# Altium project vend-PCB-003.PrjPcb
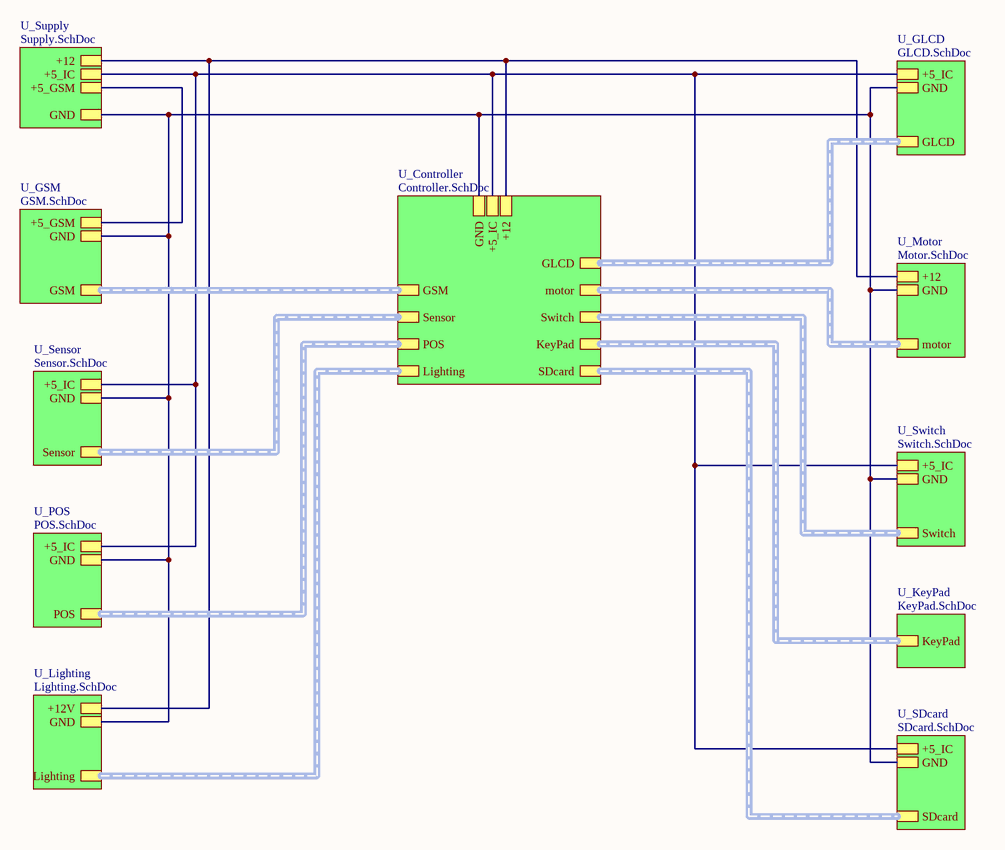
[diagram p0: main.SchDoc]
CompanyName: github.com/rshahrami; DrawnBy: rshahrami; Project_Name: vend-PCB-003; Revision: 1.0.0
12 sheets, 130 parts. Net scope: strictly hierarchical (ports join the sheet entries above them; power ports are local).
Board file: PCB.PcbDoc
Sheets:
  main.SchDoc
    U_GLCD = GLCD.SchDoc
    U_Controller = Controller.SchDoc
    U_GSM = GSM.SchDoc
    U_Motor = Motor.SchDoc
    U_POS = POS.SchDoc
    U_Sensor = Sensor.SchDoc
    U_Supply = Supply.SchDoc
    U_Switch = Switch.SchDoc
    U_KeyPad = KeyPad.SchDoc
    U_SDcard = SDcard.SchDoc
    U_Lighting = Lighting.SchDoc

## Sheet main.SchDoc
size A4; SheetNumber: 1; SheetTotal: 12

### Sub-sheets
U_Controller = Controller.SchDoc: GSM (harness GSM), motor (harness motor), Switch (harness Switch), GLCD (harness GLCD), +12, GND, Sensor (harness Sensor), KeyPad (harness KeyPad), SDcard (harness SDcard), Lighting (harness Lighting), POS (harness POS), +5_IC
U_GLCD = GLCD.SchDoc: GLCD (harness GLCD), GND, +5_IC
U_GSM = GSM.SchDoc: GND, GSM (harness GSM), +5_GSM
U_KeyPad = KeyPad.SchDoc: KeyPad (harness KeyPad)
U_Lighting = Lighting.SchDoc: +12V, GND, Lighting (harness Lighting)
U_Motor = Motor.SchDoc: motor (harness motor), +12, GND
U_POS = POS.SchDoc: POS (harness POS), GND, +5_IC
U_SDcard = SDcard.SchDoc: GND, SDcard (harness SDcard), +5_IC
U_Sensor = Sensor.SchDoc: GND, Sensor (harness Sensor), +5_IC
U_Supply = Supply.SchDoc: GND, +12, +5_GSM, +5_IC
U_Switch = Switch.SchDoc: GND, Switch (harness Switch), +5_IC

### Nets
+5_GSM: sheet U_GSM/+5_GSM, sheet U_Supply/+5_GSM
+5_IC: sheet U_GLCD/+5_IC, sheet U_Controller/+5_IC, sheet U_POS/+5_IC, sheet U_Sensor/+5_IC, sheet U_Supply/+5_IC, sheet U_Switch/+5_IC, sheet U_SDcard/+5_IC
+12: sheet U_Controller/+12, sheet U_Motor/+12, sheet U_Supply/+12, sheet U_Lighting/+12V
GND: sheet U_GLCD/GND, sheet U_Controller/GND, sheet U_GSM/GND, sheet U_Motor/GND, sheet U_POS/GND, sheet U_Sensor/GND, sheet U_Supply/GND, sheet U_Switch/GND, sheet U_SDcard/GND, sheet U_Lighting/GND

### Buses and harness runs
harness sheet U_Controller/GLCD = sheet U_GLCD/GLCD
harness sheet U_Controller/GSM = sheet U_GSM/GSM
harness sheet U_Controller/KeyPad = sheet U_KeyPad/KeyPad
harness sheet U_Controller/Lighting = sheet U_Lighting/Lighting
harness sheet U_Controller/motor = sheet U_Motor/motor
harness sheet U_Controller/POS = sheet U_POS/POS
harness sheet U_Controller/SDcard = sheet U_SDcard/SDcard
harness sheet U_Controller/Sensor = sheet U_Sensor/Sensor
harness sheet U_Controller/Switch = sheet U_Switch/Switch

## Sheet GLCD.SchDoc
size A4; SheetNumber: 5; SheetTotal: 12
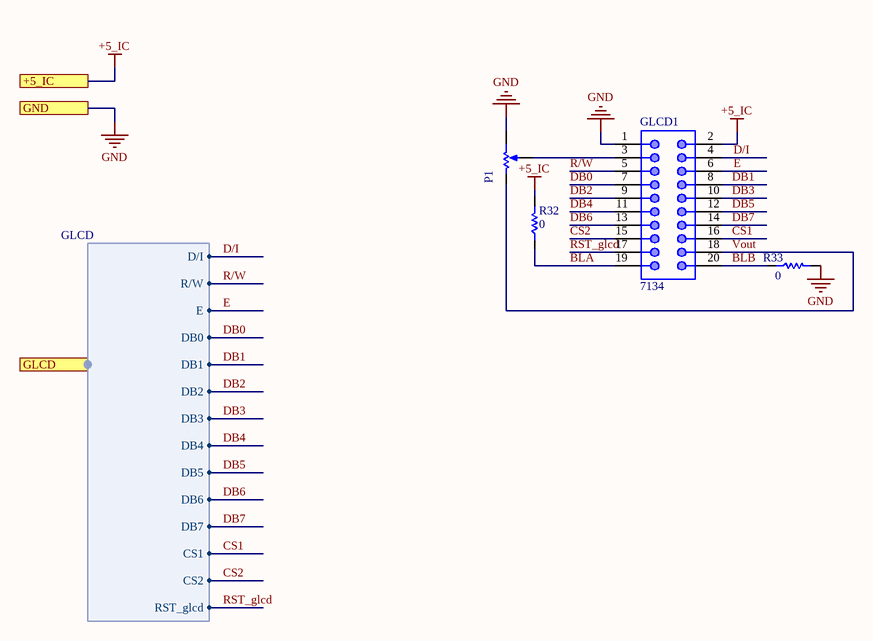
[diagram p1: GLCD.SchDoc]

### Parts
GLCD1  Inflow: 7134  [BOX-HDR-10X2-2.54mm-S]  (hidden comment: 10x2)
P1  10K  [Multi turn 01]  (value not drawn)
R32  0  [RES 1206 (3216X08L)]
R33  0  [RES 1206 (3216X08L)]

### Ports
+5_IC, GLCD (harness GLCD), GND

### Harnesses
GLCD: D/I, R/W, E, DB0, DB1, DB2, DB3, DB4, DB5, DB6, DB7, CS1, CS2, RST_glcd

### Nets
+5_IC: GLCD1.2 R32.2 ; port +5_IC
GND: GLCD1.1 P1.1 R33.2 ; port GND
BLA: GLCD1.19 R32.1
BLB: GLCD1.20 R33.1
CS1: GLCD1.16 ; port GLCD.CS1
CS2: GLCD1.15 ; port GLCD.CS2
D/I: GLCD1.4 ; port GLCD.D/I
DB0: GLCD1.7 ; port GLCD.DB0
DB1: GLCD1.8 ; port GLCD.DB1
DB2: GLCD1.9 ; port GLCD.DB2
DB3: GLCD1.10 ; port GLCD.DB3
DB4: GLCD1.11 ; port GLCD.DB4
DB5: GLCD1.12 ; port GLCD.DB5
DB6: GLCD1.13 ; port GLCD.DB6
DB7: GLCD1.14 ; port GLCD.DB7
E: GLCD1.6 ; port GLCD.E
R/W: GLCD1.5 ; port GLCD.R/W
RST_glcd: GLCD1.17 ; port GLCD.RST_glcd
Vout: GLCD1.18 P1.3
NetGLCD1_3: GLCD1.3 P1.2

### Library data of the parts
GLCD1 = Con_IDC_10x2: Male Box Header, 20 pins; Rating: Rating?; Validation: NT; Value: 10x2; Package: Package?; Type: Type?
P1 = Res_Multi: Multi Turn; Rating: Rating?; Validation: Valid; Inflow: inflow?; Package: Package?; Type: Type?; Value: 10K
R32 R33 = Res_SMD_1206: Resistor; Inflow: inflow?; Rating: 0.25W; Validation: Valid; Package: 1206; Type: 10%; Value: 0

## Sheet Controller.SchDoc
size 254 x 228 mm; SheetNumber: 2; SheetTotal: 12
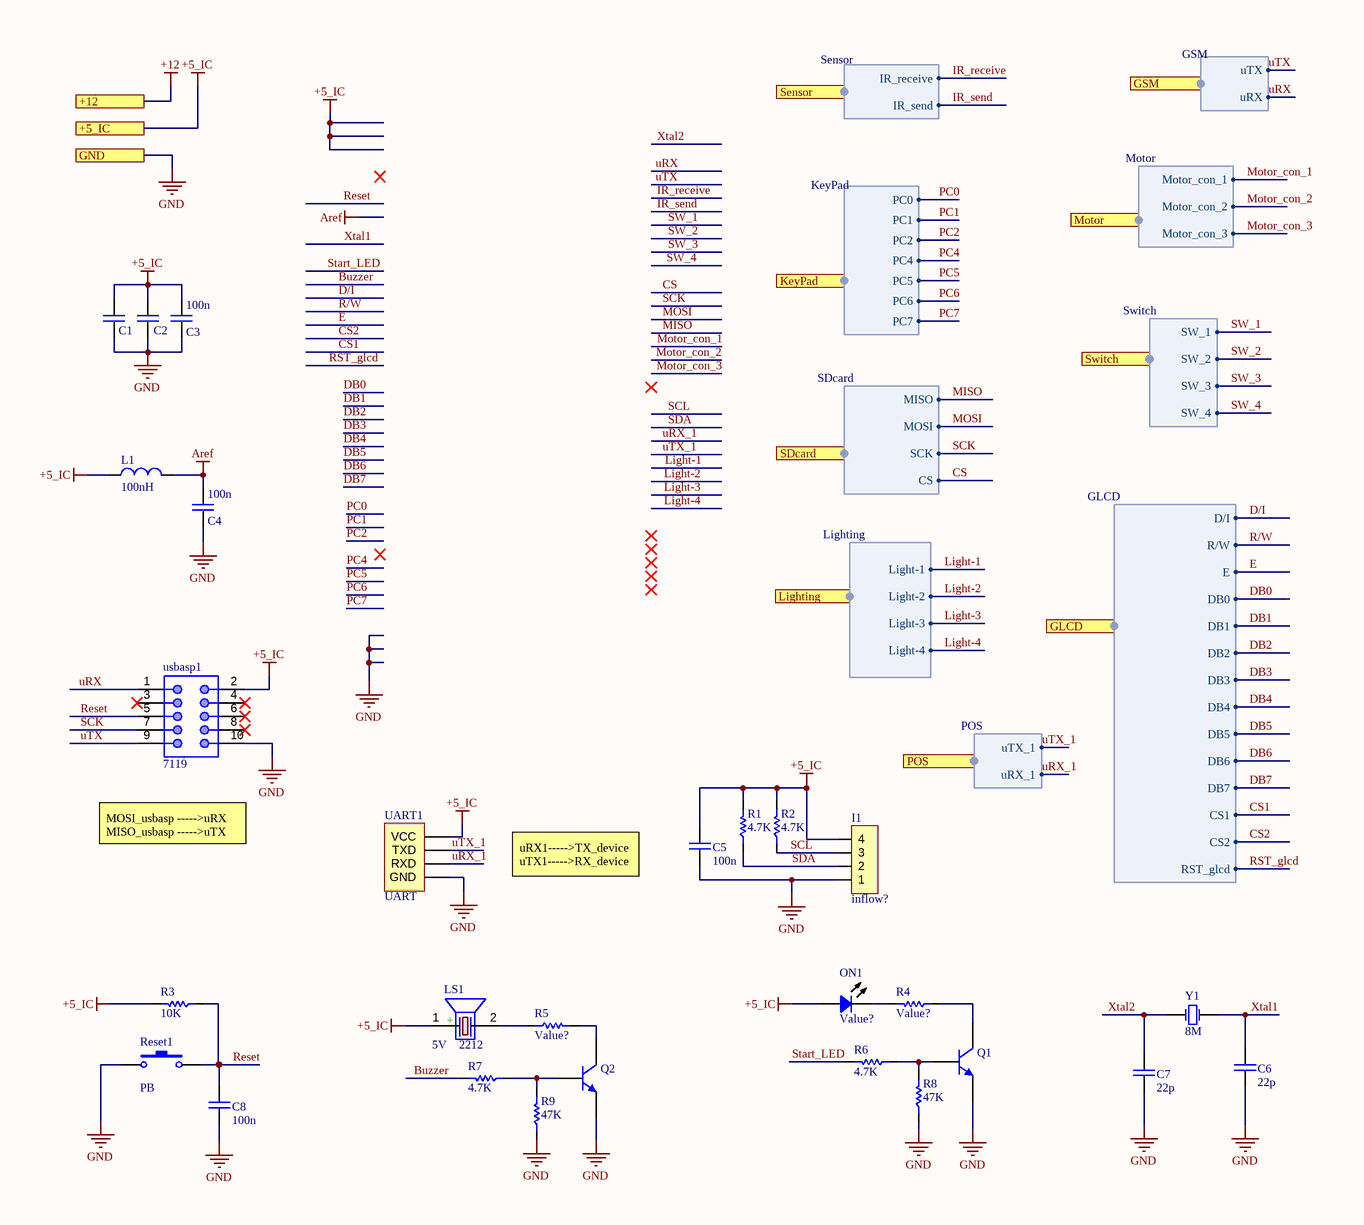
[diagram p2: Controller.SchDoc]

### Parts
C1  (no value)  [CAP 1206/3216]
C2  (no value)  [CAP 1206/3216]
C3  100n  [CAP 1206/3216]
C4  100n  [CAP 1206/3216]
C5  100n  [CAP 1206/3216]
C6  22p  [CAP 1206/3216]
C7  22p  [CAP 1206/3216]
C8  100n  [CAP 1206/3216]
I1  Inflow: inflow?  [MOLEX KK 0022272041]  (hidden comment: 4'Pin)
L1  100nH  [IND1206]
LS1  Inflow: 2212  [BZ_SJ]  (hidden comment: 5V)
ON1  Value?  [LED 1206/3216 GREEN]
Q1  NPN  [SOT23_N]  (value not drawn)
Q2  NPN  [SOT23_N]  (value not drawn)
R1  value 4.7K  [RES 1206 (3216X08L)]  (hidden comment: Value?)
R2  value 4.7K  [RES 1206 (3216X08L)]  (hidden comment: Value?)
R3  value 10K  [RES 1206 (3216X08L)]  (hidden comment: 4.7K)
R4  value Value?  [RES 1206 (3216X08L)]  (hidden comment: 47K)
R5  Value?  [RES 1206 (3216X08L)]
R6  value 4.7K  [RES 1206 (3216X08L)]  (hidden comment: Value?)
R7  4.7K  [RES 1206 (3216X08L)]
R8  value 47K  [RES 1206 (3216X08L)]  (hidden comment: 4.7K)
R9  47K  [RES 1206 (3216X08L)]
Reset1  PB  [SW_PB_SMD_2PIN_SPST_6X3X2]
UART1  UART  [MOLEX KK 0022272041]
usbasp1  Inflow: 7119  [BOX-HDR-5X2-2.54mm-S]  (hidden comment: 5x2)
Y1  8M  [XTAL Small]

### Ports
+5_IC, +12, GLCD (harness GLCD), GND, GSM (harness GSM), KeyPad (harness KeyPad), Lighting (harness Lighting), Motor (harness Motor), POS (harness POS), SDcard (harness SDcard), Sensor (harness Sensor), Switch (harness Switch)

### Harnesses
GSM: uTX, uRX
Switch: SW_1, SW_2, SW_3, SW_4
GLCD: D/I, R/W, E, DB0, DB1, DB2, DB3, DB4, DB5, DB6, DB7, CS1, CS2, RST_glcd
Sensor: IR_receive, IR_send
KeyPad: PC0, PC1, PC2, PC4, PC5, PC6, PC7
SDcard: MISO, MOSI, SCK, CS
Lighting: Light-1, Light-2, Light-3, Light-4
Motor: Motor_con_1, Motor_con_2, Motor_con_3
POS: uTX_1, uRX_1

### Nets
+5_IC: C1.1 C2.1 C3.1 C5.1 I1.4 L1.1 LS1.1(+) ON1.1 R1.2 R2.2 R3.2 UART1.1(VCC) usbasp1.2 ; port +5_IC
Aref: C4.1 L1.2
GND: C1.2 C2.2 C3.2 C4.2 C5.2 C6.2 C7.2 C8.2 I1.1 Q1.2(E) Q2.2(E) R8.1 R9.1 Reset1.1 UART1.4(GND) usbasp1.10 ; port GND
Buzzer: R7.2
Reset: C8.1 R3.1 Reset1.2 usbasp1.5
SCK: usbasp1.7 ; port SDcard.SCK
SCL: I1.3 R2.1
SDA: I1.2 R1.1
Start_LED: R6.2
uRX: usbasp1.1 ; port GSM.uRX
uRX_1: UART1.3(RXD) ; port POS.uRX_1
uTX: usbasp1.9 ; port GSM.uTX
uTX_1: UART1.2(TXD) ; port POS.uTX_1
Xtal1: C6.1 Y1.2(OSC2)
Xtal2: C7.1 Y1.1(OSC1)
NetLS1_2: LS1.2(-) R5.1
NetON1_2: ON1.2 R4.2
NetQ1_1: Q1.1(B) R6.1 R8.2
NetQ1_3: Q1.3(C) R4.1
NetQ2_1: Q2.1(B) R7.1 R9.2
NetQ2_3: Q2.3(C) R5.2

Not connected (* = marked no-connect by the designer): usbasp1 3* 4* 6* 8*

### Notes on the sheet
- MOSI_usbasp ----->uRX MISO_usbasp ----->uTX
- uRX1----->TX_device
  uTX1----->RX_device
- DWG. NO.
- REV.
- SHT.
- THIS DOCUMENT AND THE DATA DISCLOSED HEREIN OR HEREWITH IS THE PROPERTY OF ALTIUM LIMITED AND MAY BE FREELY DISTRIBUTED IN WHOLE. NO RIGHTS ARE RESERVED OR EXPRESS OR IMPLIED WARANTEE GIVEN.
- REVISION
- DESCRIPTION
- DATE
- APPROVED
- ENG:
- APPROVALS
- PROJECT
- DSN:
- CHK:
- REFERENCE DOCUMENTS
- PROJECT REVISION:
- TITLE
- DOCUMENT REVISION:
- DESIGN ITEM:
- BOM:
- FAB DWG:
- PCB DWG:
- ASSY DWG:
- SCALE:
- SIZE
- B
- CAGE CODE
- FILE NAME
- DWG NO.
- SHEET
- OF
- REV

### Library data of the parts
C1-C8 = Cap_Multi_SMD_100nF_1206: Bipolar ceramic capacitor SMD; Type: MultiLayer; Inflow: inflow?; Rating: 50V; Validation: Valid; Package: 1206
  C3-C5 C8: Value: 100n
  C6 C7: Value: 22p
I1 = Con_Signal_4: Signal Connector 4'Pin; Rating: Rating?; Validation: Valid; Value: 4'Pin; Package: Package?; Type: Type?
L1 = Ind_SMD_1206: Inductor; Inflow: inflow?; Type: SMD; Rating: Rating?; Validation: Valid; Package: 1206; Value: 100nH
LS1 = Other_Elec_Buzzer: Magnetic Transducer Buzzer; Rating: 12mm; Validation: Valid; Type: Buzzer; Package: Dip; Value: 5V
ON1 = Semi_LED_SMD: LED; Inflow: inflow?; Rating: Rating?; Validation: Valid; Package: Package?; Type: LED; Value: Value?
Q1 Q2 = Semi_BJT_BC817: NPN General purpose Transistor; Rating: Rating?; Type: Type?; Validation: Valid; Inflow: inflow?; Value: NPN; Package: Package?
R1 R2 = Res_SMD_0805: Resistor; Inflow: inflow?; Rating: 0.125W; Validation: Valid; Package: 0805; Type: 10%
R3-R9 = Res_SMD_1206: as R32 on sheet GLCD; Package: 1206; Type: 10%
  R5: Value: Value?
  R7: Value: 4.7K
  R9: Value: 47K
Reset1 = SW_PushButton_2_SMD: SMT Tactile ‎Switch; Rating: 2b; Validation: Valid; Inflow: 8260; Type: Vertical; Package: SMD; Value: PB
UART1 = Con_UART: UART Connector; Rating: Rating?; Validation: Valid; Inflow: 4528; Package: Package?; Type: Type?; Value: UART
usbasp1 = Con_IDC_5x2: Male Box Header, 10 pins; Rating: Rating?; Validation: NT; Value: 5x2; Package: Package?; Type: Type?
Y1 = Other_Elec_Xtal_THT: Crystal Oscillator; Rating: Rating?; Inflow: inflow?; Validation: Valid; Type: Quartz; Package: Dip; Value: 8M

## Sheet GSM.SchDoc
size A4; SheetNumber: 3; SheetTotal: 12
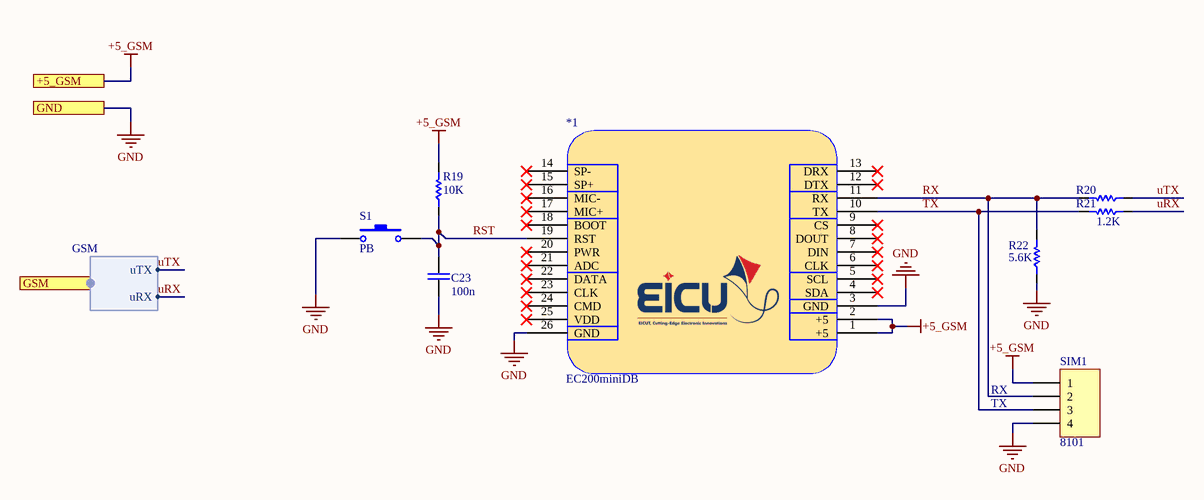
[diagram p3: GSM.SchDoc]

### Parts
*1  EC200miniDB  [PCBComponent_1]
C23  100n  [CAP 1206/3216]
R19  10K  [RES 1206 (3216X08L)]
R20  47K  [RES 1206 (3216X08L)]  (value not drawn)
R21  value 1.2K  [RES 1206 (3216X08L)]  (hidden comment: 1K)
R22  5.6K  [RES 1206 (3216X08L)]
S1  PB  [SW_PB_SMD_2PIN_SPST_6X3X2]
SIM1  Inflow: 8101  [HDR_THT_4F_2.54mm]  (hidden comment: 4)

### Ports
+5_GSM, GND, GSM (harness GSM)

### Harnesses
GSM: uTX, uRX

### Nets
+5_GSM: *1.1(+5) *1.2(+5) R19.2 SIM1.1 ; port +5_GSM
GND: *1.3(GND) *1.26(GND) C23.2 R22.1 S1.2 SIM1.4 ; port GND
RST: *1.19(RST) C23.1 R19.1 S1.1
RX: *1.11(RX) R20.2 R22.2 SIM1.2
TX: *1.10(TX) R21.2 SIM1.3
uRX: R21.1 ; port GSM.uRX
uTX: R20.1 ; port GSM.uTX

Not connected (* = marked no-connect by the designer): *1 4(SDA)* 5(SCL)* 6(CLK)* 7(DIN)* 8(DOUT)* 9(CS)* 12(DTX)* 13(DRX)* 14(SP-)* 15(SP+)* 16(MIC-)* 17(MIC+)* 18(BOOT)* 20(PWR)* 21(ADC)* 22(DATA)* 23(CLK)* 24(CMD)* 25(VDD)*

### Notes on the sheet
- RX
- TX

### Library data of the parts
*1 = EC200miniDB: EICUT.com
C23 = Cap_Multi_SMD_100nF_1206: as C1 on sheet Controller; Package: 1206; Value: 100n
R19-R22 = Res_SMD_1206: as R32 on sheet GLCD; Package: 1206; Type: 10%
  R19: Value: 10K
  R20: Value: 47K
  R22: Value: 5.6K
S1 = SW_PushButton_2_SMD: as Reset1 on sheet Controller; Type: Vertical; Package: SMD; Value: PB
SIM1 = Con_FPH_4x1_V_THT_2.54: Header, single row, 4 pin; Rating: Rating?; Validation: NT; Value: 4; Package: Package?; Type: Type?

## Sheet Motor.SchDoc
size A4; SheetNumber: 4; SheetTotal: 12
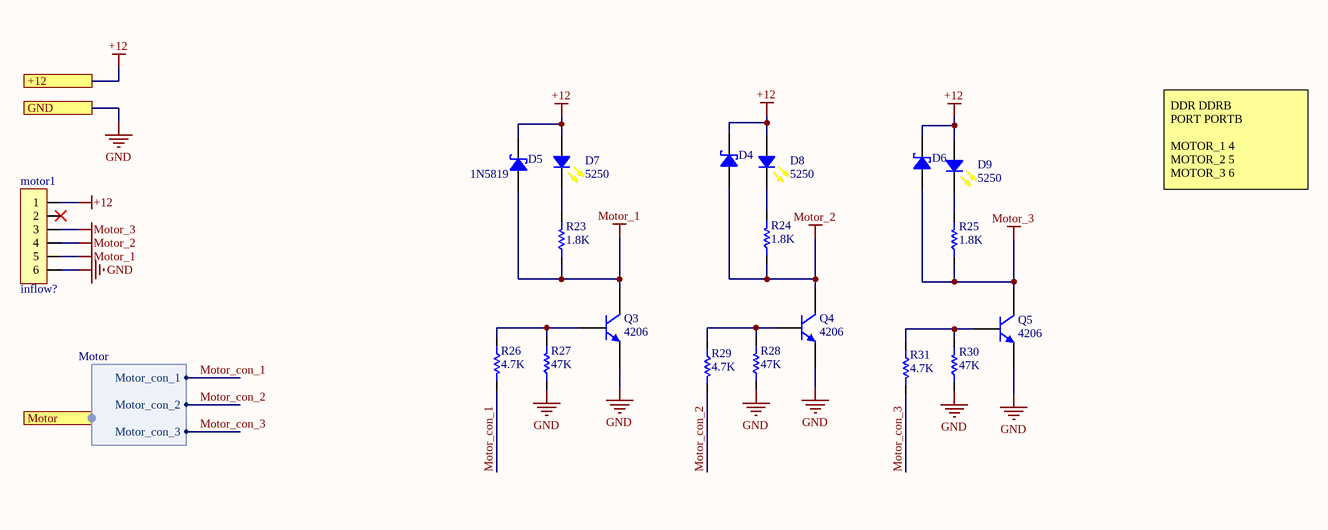
[diagram p4: Motor.SchDoc]

### Parts
D4  1N5819  [430X270D]  (value not drawn)
D5  1N5819  [430X270D]
D6  1N5819  [430X270D]  (value not drawn)
D7  Inflow: 5250  [LED 1206/3216 YELLOW]  (hidden comment: Yellow, 1206)
D8  Inflow: 5250  [LED 1206/3216 YELLOW]  (hidden comment: Yellow, 1206)
D9  Inflow: 5250  [LED 1206/3216 YELLOW]  (hidden comment: Yellow, 1206)
motor1  Inflow: inflow?  [MOLEX KK 0022272061]  (hidden comment: 6'Pin)
Q3  Inflow: 4206  [TO-220 AB]  (hidden comment: NPN)
Q4  Inflow: 4206  [TO-220 AB]  (hidden comment: NPN)
Q5  Inflow: 4206  [TO-220 AB]  (hidden comment: NPN)
R23  1.8K  [RES 1206 (3216X08L)]
R24  1.8K  [RES 1206 (3216X08L)]
R25  1.8K  [RES 1206 (3216X08L)]
R26  4.7K  [RES 1206 (3216X08L)]
R27  47K  [RES 1206 (3216X08L)]
R28  47K  [RES 1206 (3216X08L)]
R29  4.7K  [RES 1206 (3216X08L)]
R30  47K  [RES 1206 (3216X08L)]
R31  4.7K  [RES 1206 (3216X08L)]

### Ports
+12, GND, Motor (harness Motor)

### Harnesses
Motor: Motor_con_1, Motor_con_2, Motor_con_3

### Nets
+12: D4.2 D5.2 D6.2 D7.1 D8.1 D9.1 motor1.1 ; port +12
GND: motor1.6 Q3.3(E) Q4.3(E) Q5.3(E) R27.1 R28.1 R30.1 ; port GND
Motor_1: D5.1 motor1.5 Q3.2(C) R23.1
Motor_2: D4.1 motor1.4 Q4.2(C) R24.1
Motor_3: D6.1 motor1.3 Q5.2(C) R25.1
Motor_con_1: R26.2 ; port Motor.Motor_con_1
Motor_con_2: R29.2 ; port Motor.Motor_con_2
Motor_con_3: R31.2 ; port Motor.Motor_con_3
NetD7_2: D7.2 R23.2
NetD8_2: D8.2 R24.2
NetD9_2: D9.2 R25.2
NetQ3_1: Q3.1(B) R26.1 R27.2
NetQ4_1: Q4.1(B) R28.2 R29.1
NetQ5_1: Q5.1(B) R30.2 R31.1

Not connected (* = marked no-connect by the designer): motor1 2*

### Notes on the sheet
- DDR DDRB
  PORT PORTB
  MOTOR_1 4
  MOTOR_2 5
  MOTOR_3 6

### Library data of the parts
D4-D6 = Semi_Diod_Sch_1N5819_SMD: Schottky Rectifiers; Rating: Rating?; Validation: Valid; Inflow: inflow?; Package: SMA; Type: Schottky; Value: 1N5819
D7-D9 = Semi_LED_Yellow_1206: LED; Rating: Rating?; Type: Type?; Validation: Valid; Value: Yellow, 1206; Package: Package?
motor1 = Con_Signal_6: Signal Connector 6'Pin; Rating: Rating?; Validation: Valid; Value: 6'Pin; Package: Package?; Type: Type?
Q3-Q5 = Semi_BJT_TIP41C: NPN Power transistor; Rating: Rating?; Type: Type?; Validation: NT; Value: NPN; Package: Package?
R23-R31 = Res_SMD_1206: as R32 on sheet GLCD; Package: 1206; Type: 10%
  R23-R25: Value: 1.8K
  R26 R29 R31: Value: 4.7K
  R27 R28 R30: Value: 47K

## Sheet POS.SchDoc
size A4; SheetNumber: 8; SheetTotal: 12
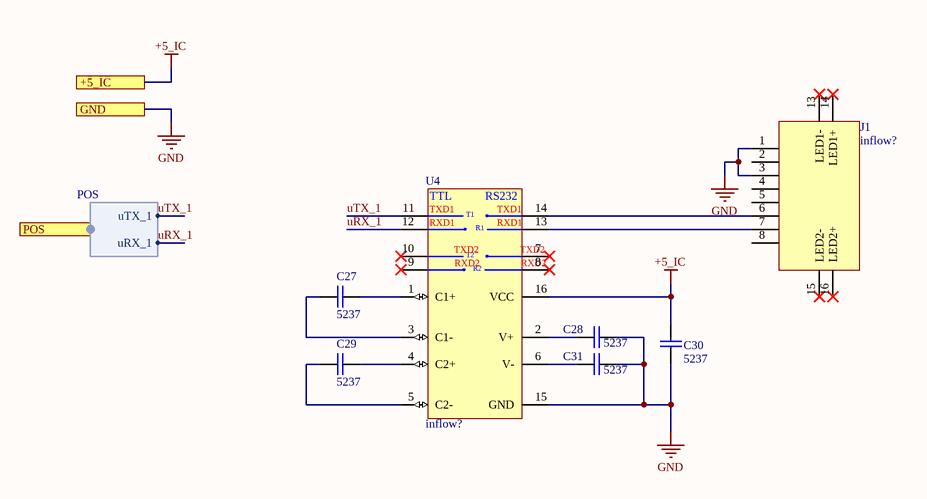
[diagram p5: POS.SchDoc]

### Parts
C27  Inflow: 5237  [CAP 1206/3216]  (hidden comment: 1u'F, 50'V)
C28  Inflow: 5237  [CAP 1206/3216]  (hidden comment: 1u'F, 50'V)
C29  Inflow: 5237  [CAP 1206/3216]  (hidden comment: 1u'F, 50'V)
C30  Inflow: 5237  [CAP 1206/3216]  (hidden comment: 1u'F, 50'V)
C31  Inflow: 5237  [CAP 1206/3216]  (hidden comment: 1u'F, 50'V)
J1  Inflow: inflow?  [RJ45_MINI]  (hidden comment: RJ45, mini)
U4  Inflow: inflow?  [NSO16_M]  (hidden comment: MAX3232)

### Ports
+5_IC, GND, POS (harness POS)

### Harnesses
POS: uTX_1, uRX_1

### Nets
+5_IC: C30.1 U4.16(VCC) ; port +5_IC
GND: C28.2 C30.2 C31.2 J1.1 J1.3 U4.15(GND) ; port GND
uRX_1: U4.12(R1OUT) ; port POS.uRX_1
uTX_1: U4.11(T1IN) ; port POS.uTX_1
NetC27_1: C27.1 U4.1(C1+)
NetC27_2: C27.2 U4.3(C1-)
NetC28_1: C28.1 U4.2(V+)
NetC29_1: C29.1 U4.4(C2+)
NetC29_2: C29.2 U4.5(C2-)
NetC31_1: C31.1 U4.6(V-)
NetJ1_6: J1.6 U4.14(T1OUT)
NetJ1_7: J1.7 U4.13(R1IN)

Not connected (* = marked no-connect by the designer): J1 2 4 5 8 13(LED1-)* 14(LED1+)* 15(LED2-)* 16(LED2+)*; U4 7(T2OUT)* 8(R2IN)* 9(R2OUT)* 10(T2IN)*

### Notes on the sheet
- (in symbol IC_Converter_MAX3232CSE) TTL; TXD1; T1; RXD1; R1; TXD2; T2; RXD2; R2

### Library data of the parts
C27-C31 = Cap_Multi_1u_50_1206: Bipolar ceramic capacitor SMD; Rating: Rating?; Type: Type?; Validation: Valid; Value: 1u'F, 50'V; Package: Package?
J1 = Con_PC_RJ45_MINI: RJ45 Mini With two LEDs; Rating: Rating?; Validation: NT; Value: RJ45, mini; Package: Package?; Type: Type?
U4 = IC_Converter_MAX3232CSE: RS-232 Interface IC 3.0V to 5.5V, Low-Power, up to 1Mbps, True RS-232 Transceivers Using Four 0.1uF External Capacitors; Rating: Rating?; Validation: Valid; Value: MAX3232; Package: SOIC-16; Type: RS232

## Sheet Sensor.SchDoc
size A4; SheetNumber: 6; SheetTotal: 12
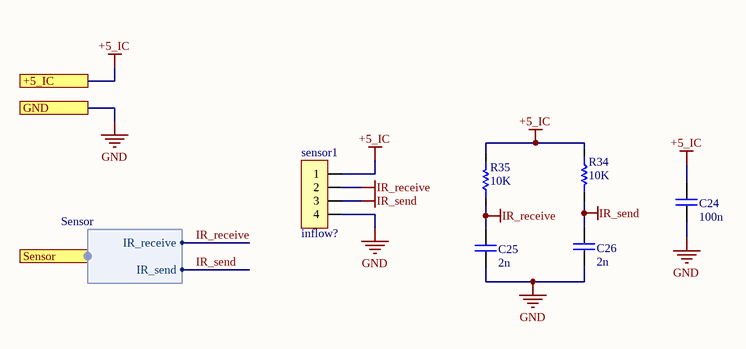
[diagram p6: Sensor.SchDoc]

### Parts
C24  100n  [CAP 1206/3216]
C25  2n  [CAP 1206/3216]
C26  2n  [CAP 1206/3216]
R34  10K  [RES 1206 (3216X08L)]
R35  10K  [RES 1206 (3216X08L)]
sensor1  Inflow: inflow?  [MOLEX KK 0022272041]  (hidden comment: 4'Pin)

### Ports
+5_IC, GND, Sensor (harness Sensor)

### Harnesses
Sensor: IR_receive, IR_send

### Nets
+5_IC: C24.1 R34.1 R35.2 sensor1.1 ; port +5_IC
GND: C24.2 C25.2 C26.2 sensor1.4 ; port GND
IR_receive: C25.1 R35.1 sensor1.2 ; port Sensor.IR_receive
IR_send: C26.1 R34.2 sensor1.3 ; port Sensor.IR_send

### Library data of the parts
C24-C26 = Cap_Multi_SMD_100nF_1206: as C1 on sheet Controller; Package: 1206
  C24: Value: 100n
  C25 C26: Value: 2n
R34 R35 = Res_SMD_1206: as R32 on sheet GLCD; Package: 1206; Type: 10%; Value: 10K
sensor1 = Con_Signal_4: as I1 on sheet Controller; Value: 4'Pin; Package: Package?; Type: Type?

## Sheet Supply.SchDoc
size A4; SheetNumber: 2; SheetTotal: 12; Time: Supply
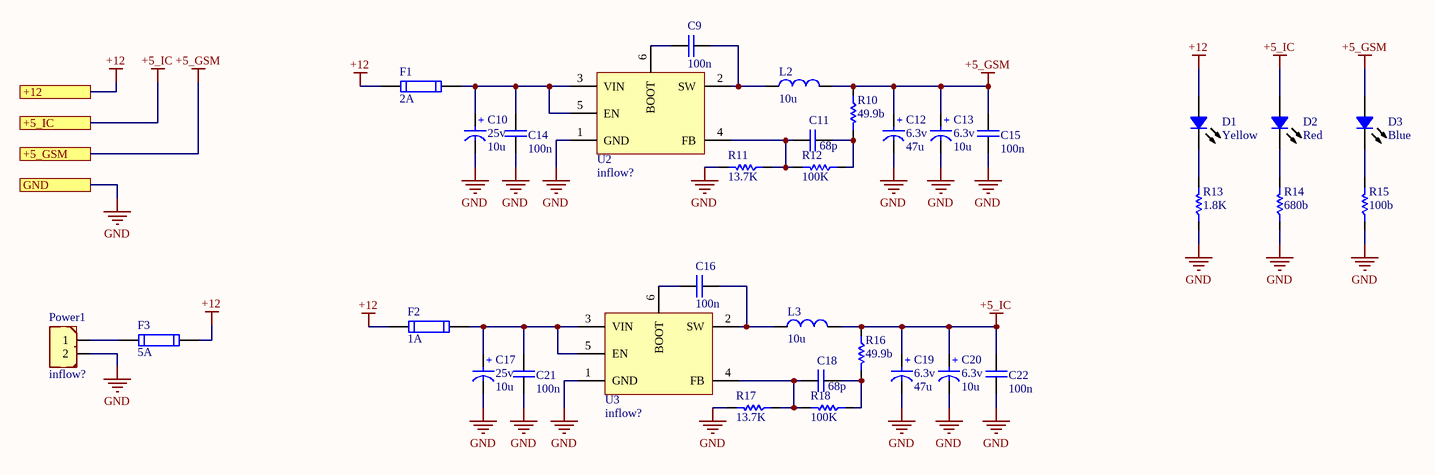
[diagram p7: Supply.SchDoc]

### Parts
C9  100n  [CAP 0805/2012]
C10  Rating: 25v  [SMT_C_Tantalum_B]  (hidden comment: 10u)
C11  68p  [CAP 0805/2012]
C12  Rating: 6.3v  [SMT_C_Tantalum_B]  (hidden comment: 47u)
C13  Rating: 6.3v  [SMT_C_Tantalum_A]  (hidden comment: 10u)
C14  100n  [CAP 1206/3216]
C15  100n  [CAP 1206/3216]
C16  100n  [CAP 0805/2012]
C17  Rating: 25v  [SMT_C_Tantalum_B]  (hidden comment: 10u)
C18  68p  [CAP 0805/2012]
C19  Rating: 6.3v  [SMT_C_Tantalum_B]  (hidden comment: 47u)
C20  Rating: 6.3v  [SMT_C_Tantalum_A]  (hidden comment: 10u)
C21  100n  [CAP 1206/3216]
C22  100n  [CAP 1206/3216]
D1  Yellow  [LED 0805/2012 YELLOW]
D2  Red  [LED 0805/2012 RED]
D3  Blue  [LED 0805/2012 BLUE]
F1  2A  [1206_F]
F2  1A  [1206_F]
F3  5A  [FUSE_BLX_20x5]
L2  10u  [L_7]
L3  10u  [L_7]
Power1  Inflow: inflow?  [Phoenix_2PIN_RA_P5.08mm]  (hidden comment: 2'Pin)
R10  49.9b  [RES 0805 (2012X06L)]
R11  13.7K  [RES 0805 (2012X06L)]
R12  100K  [RES 0805 (2012X06L)]
R13  1.8K  [RES 0805 (2012X06L)]
R14  680b  [RES 0805 (2012X06L)]
R15  100b  [RES 0805 (2012X06L)]
R16  49.9b  [RES 0805 (2012X06L)]
R17  13.7K  [RES 0805 (2012X06L)]
R18  100K  [RES 0805 (2012X06L)]
U2  Inflow: inflow?  [TPS54302]  (hidden comment: Value?)
U3  Inflow: inflow?  [TPS54302]  (hidden comment: Value?)

### Ports
+5_GSM, +5_IC, +12, GND

### Nets
+5_GSM: C12.1(+) C13.1(+) C15.1 D3.1 L2.2 R10.1 ; port +5_GSM
+5_IC: C19.1(+) C20.1(+) C22.1 D2.1 L3.2 R16.1 ; port +5_IC
+12: D1.1 F1.1 F2.1 F3.2 ; port +12
GND: C10.2(-) C12.2(-) C13.2(-) C14.2 C15.2 C17.2(-) C19.2(-) C20.2(-) C21.2 C22.2 Power1.2 R11.2 R13.1 R14.1 R15.1 R17.2 U2.1(GND) U3.1(GND) ; port GND
NetC9_1: C9.1 U2.6(BOOT)
NetC9_2: C9.2 L2.1 U2.2(SW)
NetC10_1: C10.1(+) C14.1 F1.2 U2.3(VIN) U2.5(EN)
NetC11_1: C11.1 R11.1 R12.2 U2.4(FB)
NetC11_2: C11.2 R10.2 R12.1
NetC16_1: C16.1 U3.6(BOOT)
NetC16_2: C16.2 L3.1 U3.2(SW)
NetC17_1: C17.1(+) C21.1 F2.2 U3.3(VIN) U3.5(EN)
NetC18_1: C18.1 R17.1 R18.2 U3.4(FB)
NetC18_2: C18.2 R16.2 R18.1
NetD1_2: D1.2 R13.2
NetD2_2: D2.2 R14.2
NetD3_2: D3.2 R15.2
NetF3_1: F3.1 Power1.1

### Notes on the sheet
- Title:
- Project:
- Drawn by:
- Revision:
- Hossein Bagheri
- Company:
- Sheet
- of

### Library data of the parts
C9 C16 = Cap_Multi_SMD_100nF_0805: Bipolar ceramic capacitor SMD; Inflow: inflow?; Type: MultiLayer; Rating: 50V; Validation: Valid; Package: 0805; Value: 100n
C10 C12 C13 C17 C19 C20 = Cap_Tantalum: Tantalum Capacitor,TAJ Series-SMD; Inflow: inflow?; Validation: Valid; Package: Package?; Type: Tantalum
  C10 C13 C17 C20: Value: 10u
  C12 C19: Value: 47u
C11 C18 = Cap_Multi_SMD_0805: Bipolar ceramic capacitor SMD; Inflow: inflow?; Type: MultiLayer; Rating: Rating?; Validation: Valid; Package: 0805; Value: 68p
C14 C15 C21 C22 = Cap_Multi_SMD_100nF_1206: as C1 on sheet Controller; Package: 1206; Value: 100n
D1-D3 = Semi_LED_SMD: as ON1 on sheet Controller; Package: Package?; Type: LED
  D1: Value: Yellow
  D2: Value: Red
  D3: Value: Blue
F1 F2 = Other_Elec_Fuse_SMD: Short circiut  protection; Inflow: inflow?; Type: Fast; Rating: Rating?; Validation: Valid; Package: 1206
  F1: Value: 2A
  F2: Value: 1A
F3 = Other_Elec_Fuse_THT: Short circiut  protection; Type: Type?; Inflow: inflow?; Rating: Rating?; Validation: Valid; Package: Package?; Value: 5A
L2 L3 = Ind_SMD: Inductor; Inflow: inflow?; Type: Type?; Rating: 3.8A; Validation: Valid; Package: Package?; Value: 10u
Power1 = Con_Power_2: Power Connector 2'Pin; Rating: Rating?; Validation: NT; Value: 2'Pin; Package: Package?; Type: Type?
R10-R18 = Res_SMD_0805: as R1 on sheet Controller; Package: 0805
  R10 R16: Type: 1%; Value: 49.9b
  R11 R17: Type: 1%; Value: 13.7K
  R12 R18: Type: 1%; Value: 100K
  R13: Type: 10%; Value: 1.8K
  R14: Type: 10%; Value: 680b
  R15: Type: 10%; Value: 100b
U2 U3 = IC_Reg_TPS54302: 3'A Synchronous Step-Down Converter; Rating: S; Validation: Valid; Value: Value?; Type: Switching; Package: SOT-23-6

## Sheet Switch.SchDoc
size A; SheetNumber: 7; SheetTotal: 12
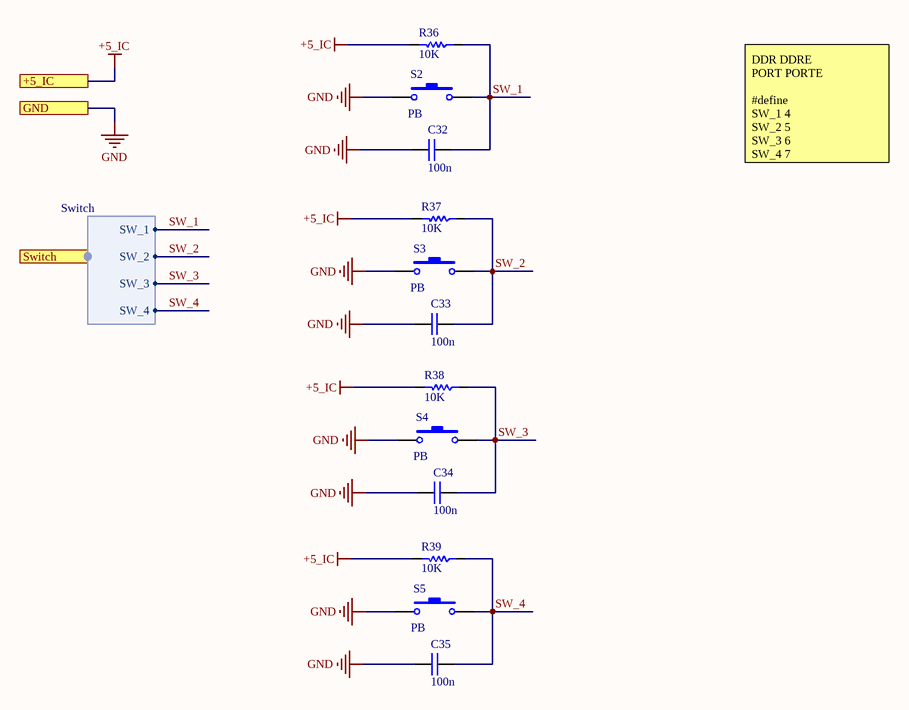
[diagram p8: Switch.SchDoc]

### Parts
C32  100n  [CAP 1206/3216]
C33  100n  [CAP 1206/3216]
C34  100n  [CAP 1206/3216]
C35  100n  [CAP 1206/3216]
R36  10K  [RES 1206 (3216X08L)]
R37  10K  [RES 1206 (3216X08L)]
R38  10K  [RES 1206 (3216X08L)]
R39  10K  [RES 1206 (3216X08L)]
S2  PB  [SW_PB_SMD_2PIN_SPST_6X3X2]
S3  PB  [SW_PB_SMD_2PIN_SPST_6X3X2]
S4  PB  [SW_PB_SMD_2PIN_SPST_6X3X2]
S5  PB  [SW_PB_SMD_2PIN_SPST_6X3X2]

### Ports
+5_IC, GND, Switch (harness Switch)

### Harnesses
Switch: SW_1, SW_2, SW_3, SW_4

### Nets
+5_IC: R36.2 R37.2 R38.2 R39.2 ; port +5_IC
GND: C32.2 C33.2 C34.2 C35.2 S2.1 S3.1 S4.1 S5.1 ; port GND
SW_1: C32.1 R36.1 S2.2 ; port Switch.SW_1
SW_2: C33.1 R37.1 S3.2 ; port Switch.SW_2
SW_3: C34.1 R38.1 S4.2 ; port Switch.SW_3
SW_4: C35.1 R39.1 S5.2 ; port Switch.SW_4

### Notes on the sheet
- DDR DDRE
  PORT PORTE
  #define
  SW_1 4
  SW_2 5
  SW_3 6
  SW_4 7

### Library data of the parts
C32-C35 = Cap_Multi_SMD_100nF_1206: as C1 on sheet Controller; Package: 1206; Value: 100n
R36-R39 = Res_SMD_1206: as R32 on sheet GLCD; Package: 1206; Type: 10%; Value: 10K
S2-S5 = SW_PushButton_2_SMD: as Reset1 on sheet Controller; Type: Vertical; Package: SMD; Value: PB

## Sheet KeyPad.SchDoc
size A; SheetNumber: 9; SheetTotal: 12
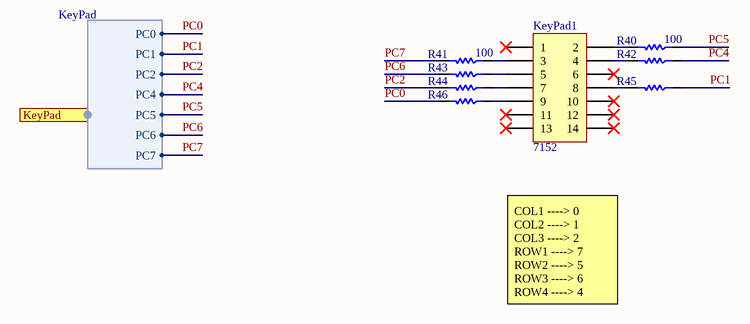
[diagram p9: KeyPad.SchDoc]

### Parts
KeyPad1  Inflow: 7152  [HDR_THT_7x2M_2.54mm]  (hidden comment: 7x2)
R40  100  [RES 1206 (3216X08L)]
R41  100  [RES 1206 (3216X08L)]
R42  (no value)  [RES 1206 (3216X08L)]
R43  (no value)  [RES 1206 (3216X08L)]
R44  (no value)  [RES 1206 (3216X08L)]
R45  (no value)  [RES 1206 (3216X08L)]
R46  (no value)  [RES 1206 (3216X08L)]

### Ports
KeyPad (harness KeyPad)

### Harnesses
KeyPad: PC0, PC1, PC2, PC4, PC5, PC6, PC7

### Nets
PC0: R46.2 ; port KeyPad.PC0
PC1: R45.1 ; port KeyPad.PC1
PC2: R44.2 ; port KeyPad.PC2
PC4: R42.1 ; port KeyPad.PC4
PC5: R40.1 ; port KeyPad.PC5
PC6: R43.2 ; port KeyPad.PC6
PC7: R41.2 ; port KeyPad.PC7
NetKeyPad1_2: KeyPad1.2 R40.2
NetKeyPad1_3: KeyPad1.3 R41.1
NetKeyPad1_4: KeyPad1.4 R42.2
NetKeyPad1_5: KeyPad1.5 R43.1
NetKeyPad1_7: KeyPad1.7 R44.1
NetKeyPad1_8: KeyPad1.8 R45.2
NetKeyPad1_9: KeyPad1.9 R46.1

Not connected (* = marked no-connect by the designer): KeyPad1 1* 6* 10* 11* 12* 13* 14*

### Notes on the sheet
- COL1 ----> 0
  COL2 ----> 1
  COL3 ----> 2
  ROW1 ----> 7
  ROW2 ----> 5
  ROW3 ----> 6
  ROW4 ----> 4

### Library data of the parts
KeyPad1 = Con_MPH_7x2_V_THT_2.54: Header, dual row, 14 pin; Rating: Rating?; Validation: NT; Value: 7x2; Package: Package?; Type: Type?
R40-R46 = Res_SMD_1206: as R32 on sheet GLCD; Package: 1206; Type: 10%
  R40 R41: Value: 100

## Sheet SDcard.SchDoc
size A; SheetNumber: 10; SheetTotal: 12
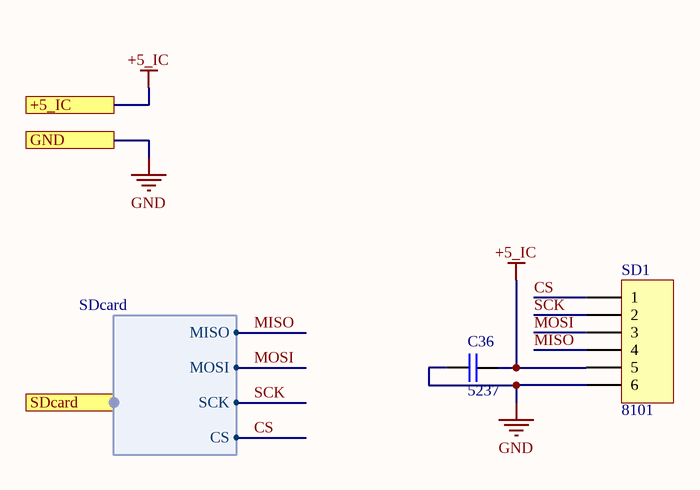
[diagram p10: SDcard.SchDoc]

### Parts
C36  Inflow: 5237  [CAP 1206/3216]  (hidden comment: 1u'F, 50'V)
SD1  Inflow: 8101  [HDR_THT_6F_2.54mm]  (hidden comment: 6)

### Ports
+5_IC, GND, SDcard (harness SDcard)

### Harnesses
SDcard: MISO, MOSI, SCK, CS

### Nets
+5_IC: C36.2 SD1.5 ; port +5_IC
GND: C36.1 SD1.6 ; port GND
CS: SD1.1 ; port SDcard.CS
MISO: SD1.4 ; port SDcard.MISO
MOSI: SD1.3 ; port SDcard.MOSI
SCK: SD1.2 ; port SDcard.SCK

### Library data of the parts
C36 = Cap_Multi_1u_50_1206: as C27 on sheet POS; Value: 1u'F, 50'V; Package: Package?
SD1 = Con_FPH_6x1_V_THT_2.54: Header, single row, 6 pin; Rating: Rating?; Validation: NT; Value: 6; Package: Package?; Type: Type?

## Sheet Lighting.SchDoc
size A; SheetNumber: 11; SheetTotal: 12
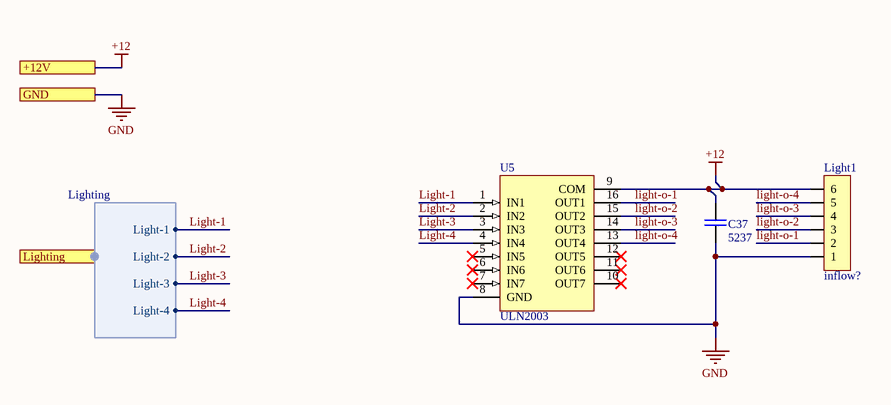
[diagram p11: Lighting.SchDoc]

### Parts
C37  Inflow: 5237  [CAP 1206/3216]  (hidden comment: 1u'F, 50'V)
Light1  Inflow: inflow?  [MOLEX KK 0022272061]  (hidden comment: 6'Pin)
U5  ULN2003  [SO16_M]

### Ports
+12V, GND, Lighting (harness Lighting)

### Harnesses
Lighting: Light-1, Light-2, Light-3, Light-4

### Nets
+12: C37.2 Light1.6 U5.9(COM) ; port +12V
GND: C37.1 Light1.1 U5.8(GND) ; port GND
Light-1: U5.1(IN1) ; port Lighting.Light-1
Light-2: U5.2(IN2) ; port Lighting.Light-2
Light-3: U5.3(IN3) ; port Lighting.Light-3
Light-4: U5.4(IN4) ; port Lighting.Light-4
light-o-1: Light1.2 U5.16(OUT1)
light-o-2: Light1.3 U5.15(OUT2)
light-o-3: Light1.4 U5.14(OUT3)
light-o-4: Light1.5 U5.13(OUT4)

Not connected (* = marked no-connect by the designer): U5 5(IN5)* 6(IN6)* 7(IN7)* 10(OUT7)* 11(OUT6)* 12(OUT5)*

### Library data of the parts
C37 = Cap_Multi_1u_50_1206: as C27 on sheet POS; Value: 1u'F, 50'V; Package: Package?
Light1 = Con_Signal_6: as motor1 on sheet Motor; Value: 6'Pin; Package: Package?; Type: Type?
U5 = IC_Driver_ULN2003: Seven darlington array drivers; Rating: Rating?; Validation: Valid; Inflow: 1506; Package: SO-16; Type: Driver; Value: ULN2003

## Nets that join several sheets
+5_GSM: GSM (*1.1 *1.2 R19.2 SIM1.1), Supply (6 pins)
+5_IC: GLCD (GLCD1.2 R32.2), Controller (13 pins), POS (C30.1 U4.16), Sensor (C24.1 R34.1 R35.2 sensor1.1), Supply (6 pins), Switch (R36.2 R37.2 R38.2 R39.2), SDcard (C36.2 SD1.5)
+12: Motor (7 pins), Supply (D1.1 F1.1 F2.1 F3.2), Lighting (C37.2 Light1.6 U5.9)
GND: GLCD (GLCD1.1 P1.1 R33.2), Controller (16 pins), GSM (6 pins), Motor (7 pins), POS (6 pins), Sensor (C24.2 C25.2 C26.2 sensor1.4), Supply (18 pins), Switch (8 pins), SDcard (C36.1 SD1.6), Lighting (C37.1 Light1.1 U5.8)
SCK: Controller (usbasp1.7), SDcard (SD1.2)
uRX: Controller (usbasp1.1), GSM (R21.1)
uRX_1: Controller (UART1.3), POS (U4.12)
uTX: Controller (usbasp1.9), GSM (R20.1)
uTX_1: Controller (UART1.2), POS (U4.11)